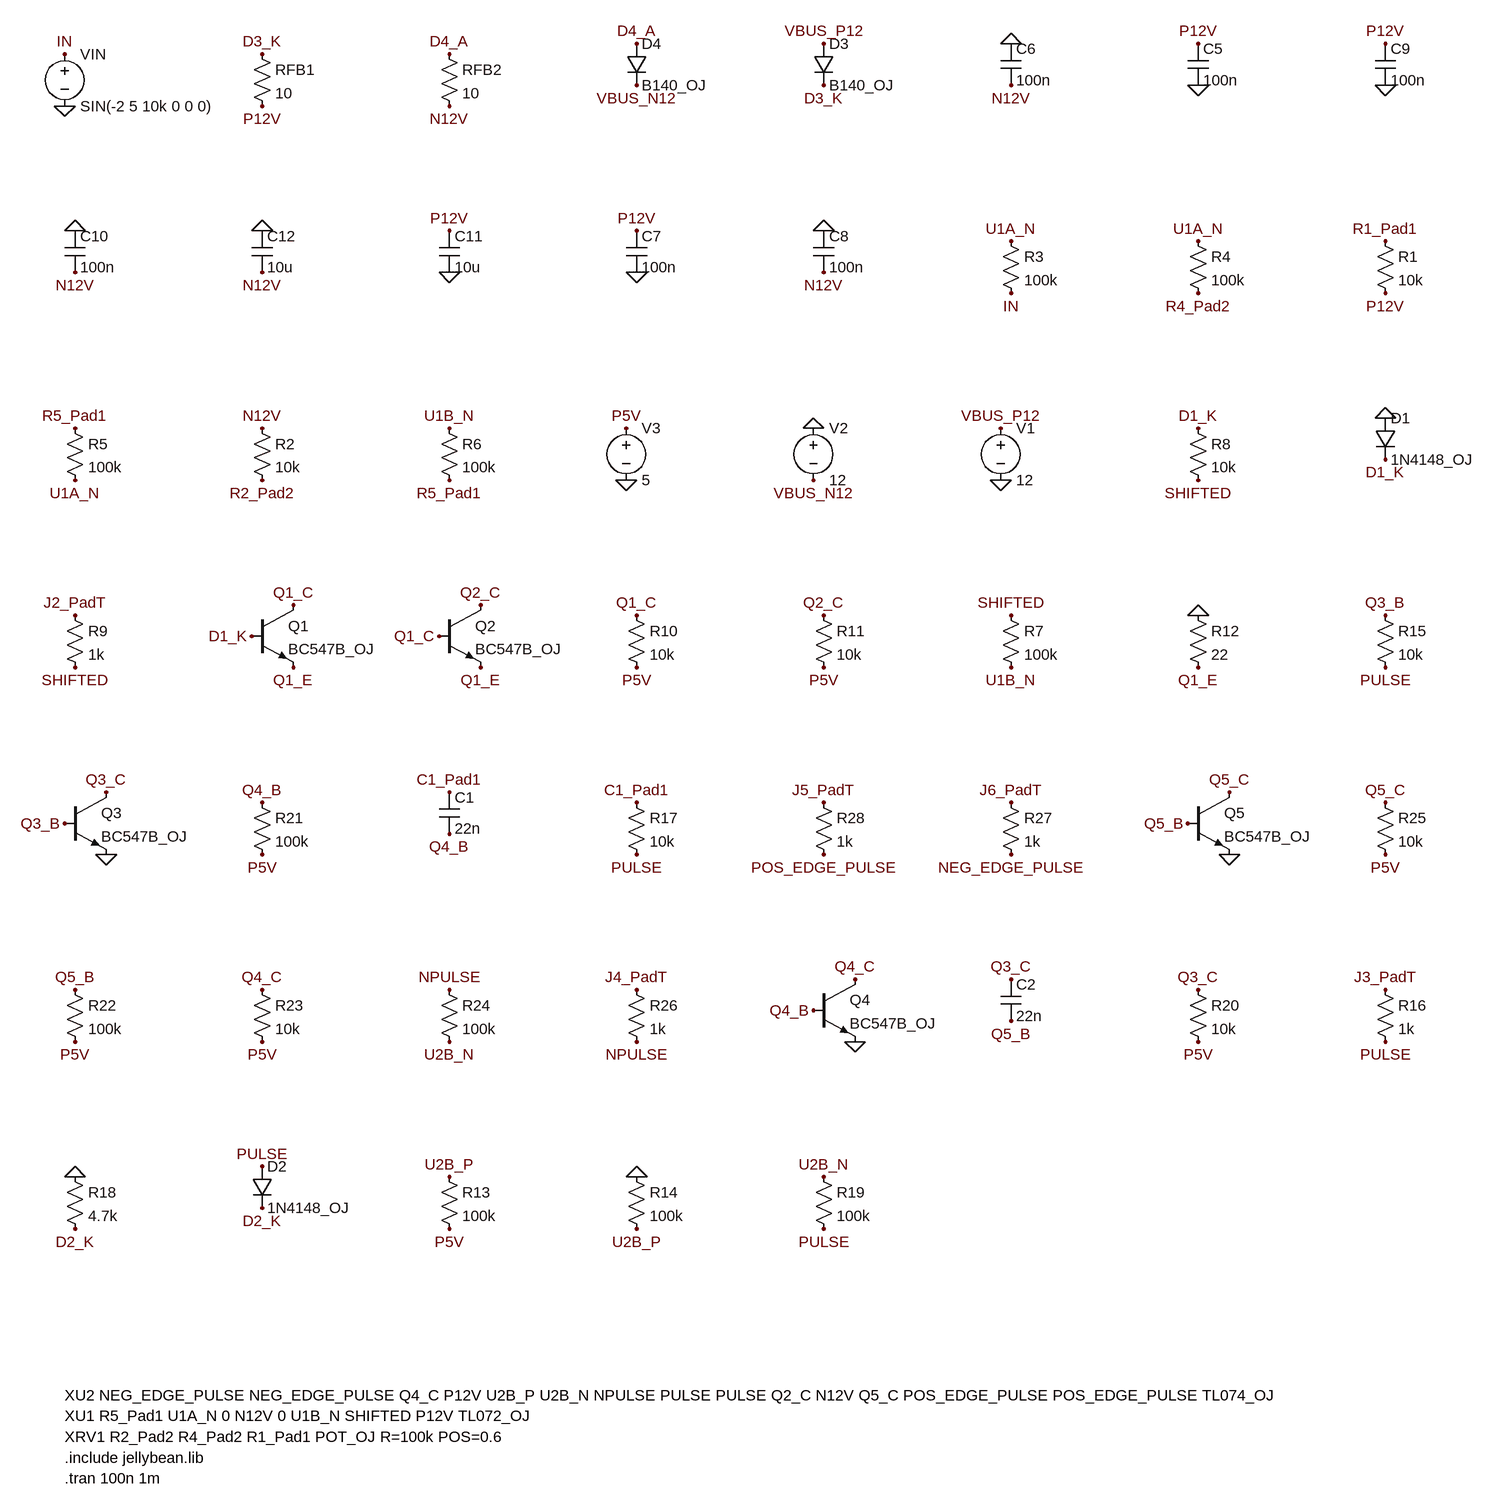
[diagram p0: schematic edges.asc]
edges.asc, the LTspice schematic file:
Version 4.1
SHEET 1 2400 1600
FLAG 0 16 IN
FLAG 0 96 0
FLAG 304 16 D3_K
FLAG 304 96 P12V
FLAG 592 16 D4_A
FLAG 592 96 N12V
FLAG 880 0 D4_A
FLAG 880 64 VBUS_N12
FLAG 1168 0 VBUS_P12
FLAG 1168 64 D3_K
FLAG 1456 0 0
FLAG 1456 64 N12V
FLAG 1744 0 P12V
FLAG 1744 64 0
FLAG 2032 0 P12V
FLAG 2032 64 0
FLAG 16 288 0
FLAG 16 352 N12V
FLAG 304 288 0
FLAG 304 352 N12V
FLAG 592 288 P12V
FLAG 592 352 0
FLAG 880 288 P12V
FLAG 880 352 0
FLAG 1168 288 0
FLAG 1168 352 N12V
FLAG 1456 304 U1A_N
FLAG 1456 384 IN
FLAG 1744 304 U1A_N
FLAG 1744 384 R4_Pad2
FLAG 2032 304 R1_Pad1
FLAG 2032 384 P12V
FLAG 16 592 R5_Pad1
FLAG 16 672 U1A_N
FLAG 304 592 N12V
FLAG 304 672 R2_Pad2
FLAG 592 592 U1B_N
FLAG 592 672 R5_Pad1
FLAG 864 592 P5V
FLAG 864 672 0
FLAG 1152 592 0
FLAG 1152 672 VBUS_N12
FLAG 1440 592 VBUS_P12
FLAG 1440 672 0
FLAG 1744 592 D1_K
FLAG 1744 672 SHIFTED
FLAG 2032 576 0
FLAG 2032 640 D1_K
FLAG 16 880 J2_PadT
FLAG 16 960 SHIFTED
FLAG 352 864 Q1_C
FLAG 288 912 D1_K
FLAG 352 960 Q1_E
FLAG 640 864 Q2_C
FLAG 576 912 Q1_C
FLAG 640 960 Q1_E
FLAG 880 880 Q1_C
FLAG 880 960 P5V
FLAG 1168 880 Q2_C
FLAG 1168 960 P5V
FLAG 1456 880 SHIFTED
FLAG 1456 960 U1B_N
FLAG 1744 880 0
FLAG 1744 960 Q1_E
FLAG 2032 880 Q3_B
FLAG 2032 960 PULSE
FLAG 64 1152 Q3_C
FLAG 0 1200 Q3_B
FLAG 64 1248 0
FLAG 304 1168 Q4_B
FLAG 304 1248 P5V
FLAG 592 1152 C1_Pad1
FLAG 592 1216 Q4_B
FLAG 880 1168 C1_Pad1
FLAG 880 1248 PULSE
FLAG 1168 1168 J5_PadT
FLAG 1168 1248 POS_EDGE_PULSE
FLAG 1456 1168 J6_PadT
FLAG 1456 1248 NEG_EDGE_PULSE
FLAG 1792 1152 Q5_C
FLAG 1728 1200 Q5_B
FLAG 1792 1248 0
FLAG 2032 1168 Q5_C
FLAG 2032 1248 P5V
FLAG 16 1456 Q5_B
FLAG 16 1536 P5V
FLAG 304 1456 Q4_C
FLAG 304 1536 P5V
FLAG 592 1456 NPULSE
FLAG 592 1536 U2B_N
FLAG 880 1456 J4_PadT
FLAG 880 1536 NPULSE
FLAG 1216 1440 Q4_C
FLAG 1152 1488 Q4_B
FLAG 1216 1536 0
FLAG 1456 1440 Q3_C
FLAG 1456 1504 Q5_B
FLAG 1744 1456 Q3_C
FLAG 1744 1536 P5V
FLAG 2032 1456 J3_PadT
FLAG 2032 1536 PULSE
FLAG 16 1744 0
FLAG 16 1824 D2_K
FLAG 304 1728 PULSE
FLAG 304 1792 D2_K
FLAG 592 1744 U2B_P
FLAG 592 1824 P5V
FLAG 880 1744 0
FLAG 880 1824 U2B_P
FLAG 1168 1744 U2B_N
FLAG 1168 1824 PULSE
SYMBOL voltage 0 0 R0
SYMATTR InstName VIN
SYMATTR Value SIN(-2 5 10k 0 0 0)
SYMATTR Value2 AC 1
SYMBOL res 288 0 R0
SYMATTR InstName RFB1
SYMATTR Value 10
SYMBOL res 576 0 R0
SYMATTR InstName RFB2
SYMATTR Value 10
SYMBOL diode 864 0 R0
SYMATTR InstName D4
SYMATTR Value B140_OJ
SYMBOL diode 1152 0 R0
SYMATTR InstName D3
SYMATTR Value B140_OJ
SYMBOL cap 1440 0 R0
SYMATTR InstName C6
SYMATTR Value 100n
SYMBOL cap 1728 0 R0
SYMATTR InstName C5
SYMATTR Value 100n
SYMBOL cap 2016 0 R0
SYMATTR InstName C9
SYMATTR Value 100n
SYMBOL cap 0 288 R0
SYMATTR InstName C10
SYMATTR Value 100n
SYMBOL cap 288 288 R0
SYMATTR InstName C12
SYMATTR Value 10u
SYMBOL cap 576 288 R0
SYMATTR InstName C11
SYMATTR Value 10u
SYMBOL cap 864 288 R0
SYMATTR InstName C7
SYMATTR Value 100n
SYMBOL cap 1152 288 R0
SYMATTR InstName C8
SYMATTR Value 100n
SYMBOL res 1440 288 R0
SYMATTR InstName R3
SYMATTR Value 100k
SYMBOL res 1728 288 R0
SYMATTR InstName R4
SYMATTR Value 100k
SYMBOL res 2016 288 R0
SYMATTR InstName R1
SYMATTR Value 10k
SYMBOL res 0 576 R0
SYMATTR InstName R5
SYMATTR Value 100k
SYMBOL res 288 576 R0
SYMATTR InstName R2
SYMATTR Value 10k
SYMBOL res 576 576 R0
SYMATTR InstName R6
SYMATTR Value 100k
SYMBOL voltage 864 576 R0
SYMATTR InstName V3
SYMATTR Value 5
SYMBOL voltage 1152 576 R0
SYMATTR InstName V2
SYMATTR Value 12
SYMBOL voltage 1440 576 R0
SYMATTR InstName V1
SYMATTR Value 12
SYMBOL res 1728 576 R0
SYMATTR InstName R8
SYMATTR Value 10k
SYMBOL diode 2016 576 R0
SYMATTR InstName D1
SYMATTR Value 1N4148_OJ
SYMBOL res 0 864 R0
SYMATTR InstName R9
SYMATTR Value 1k
SYMBOL npn 288 864 R0
SYMATTR InstName Q1
SYMATTR Value BC547B_OJ
SYMBOL npn 576 864 R0
SYMATTR InstName Q2
SYMATTR Value BC547B_OJ
SYMBOL res 864 864 R0
SYMATTR InstName R10
SYMATTR Value 10k
SYMBOL res 1152 864 R0
SYMATTR InstName R11
SYMATTR Value 10k
SYMBOL res 1440 864 R0
SYMATTR InstName R7
SYMATTR Value 100k
SYMBOL res 1728 864 R0
SYMATTR InstName R12
SYMATTR Value 22
SYMBOL res 2016 864 R0
SYMATTR InstName R15
SYMATTR Value 10k
SYMBOL npn 0 1152 R0
SYMATTR InstName Q3
SYMATTR Value BC547B_OJ
SYMBOL res 288 1152 R0
SYMATTR InstName R21
SYMATTR Value 100k
SYMBOL cap 576 1152 R0
SYMATTR InstName C1
SYMATTR Value 22n
SYMBOL res 864 1152 R0
SYMATTR InstName R17
SYMATTR Value 10k
SYMBOL res 1152 1152 R0
SYMATTR InstName R28
SYMATTR Value 1k
SYMBOL res 1440 1152 R0
SYMATTR InstName R27
SYMATTR Value 1k
SYMBOL npn 1728 1152 R0
SYMATTR InstName Q5
SYMATTR Value BC547B_OJ
SYMBOL res 2016 1152 R0
SYMATTR InstName R25
SYMATTR Value 10k
SYMBOL res 0 1440 R0
SYMATTR InstName R22
SYMATTR Value 100k
SYMBOL res 288 1440 R0
SYMATTR InstName R23
SYMATTR Value 10k
SYMBOL res 576 1440 R0
SYMATTR InstName R24
SYMATTR Value 100k
SYMBOL res 864 1440 R0
SYMATTR InstName R26
SYMATTR Value 1k
SYMBOL npn 1152 1440 R0
SYMATTR InstName Q4
SYMATTR Value BC547B_OJ
SYMBOL cap 1440 1440 R0
SYMATTR InstName C2
SYMATTR Value 22n
SYMBOL res 1728 1440 R0
SYMATTR InstName R20
SYMATTR Value 10k
SYMBOL res 2016 1440 R0
SYMATTR InstName R16
SYMATTR Value 1k
SYMBOL res 0 1728 R0
SYMATTR InstName R18
SYMATTR Value 4.7k
SYMBOL diode 288 1728 R0
SYMATTR InstName D2
SYMATTR Value 1N4148_OJ
SYMBOL res 576 1728 R0
SYMATTR InstName R13
SYMATTR Value 100k
SYMBOL res 864 1728 R0
SYMATTR InstName R14
SYMATTR Value 100k
SYMBOL res 1152 1728 R0
SYMATTR InstName R19
SYMATTR Value 100k
TEXT 0 2080 Left 2 !XU2 NEG_EDGE_PULSE NEG_EDGE_PULSE Q4_C P12V U2B_P U2B_N NPULSE PULSE PULSE Q2_C N12V Q5_C POS_EDGE_PULSE POS_EDGE_PULSE TL074_OJ
TEXT 0 2112 Left 2 !XU1 R5_Pad1 U1A_N 0 N12V 0 U1B_N SHIFTED P12V TL072_OJ
TEXT 0 2144 Left 2 !XRV1 R2_Pad2 R4_Pad2 R1_Pad1 POT_OJ R=100k POS=0.6
TEXT 0 2176 Left 2 !.include jellybean.lib
TEXT 0 2208 Left 2 !.tran 100n 1m

The netlist it stands for:
* edges.asc
VIN IN 0 SIN(-2 5 10k 0 0 0) AC 1
RFB1 D3_K P12V 10
RFB2 D4_A N12V 10
D4 D4_A VBUS_N12 B140_OJ
D3 VBUS_P12 D3_K B140_OJ
C6 0 N12V 100n
C5 P12V 0 100n
C9 P12V 0 100n
C10 0 N12V 100n
C12 0 N12V 10u
C11 P12V 0 10u
C7 P12V 0 100n
C8 0 N12V 100n
R3 U1A_N IN 100k
R4 U1A_N R4_Pad2 100k
R1 R1_Pad1 P12V 10k
R5 R5_Pad1 U1A_N 100k
R2 N12V R2_Pad2 10k
R6 U1B_N R5_Pad1 100k
V3 P5V 0 5
V2 0 VBUS_N12 12
V1 VBUS_P12 0 12
R8 D1_K SHIFTED 10k
D1 0 D1_K 1N4148_OJ
R9 J2_PadT SHIFTED 1k
Q1 Q1_C D1_K Q1_E 0 BC547B_OJ
Q2 Q2_C Q1_C Q1_E 0 BC547B_OJ
R10 Q1_C P5V 10k
R11 Q2_C P5V 10k
R7 SHIFTED U1B_N 100k
R12 0 Q1_E 22
R15 Q3_B PULSE 10k
Q3 Q3_C Q3_B 0 0 BC547B_OJ
R21 Q4_B P5V 100k
C1 C1_Pad1 Q4_B 22n
R17 C1_Pad1 PULSE 10k
R28 J5_PadT POS_EDGE_PULSE 1k
R27 J6_PadT NEG_EDGE_PULSE 1k
Q5 Q5_C Q5_B 0 0 BC547B_OJ
R25 Q5_C P5V 10k
R22 Q5_B P5V 100k
R23 Q4_C P5V 10k
R24 NPULSE U2B_N 100k
R26 J4_PadT NPULSE 1k
Q4 Q4_C Q4_B 0 0 BC547B_OJ
C2 Q3_C Q5_B 22n
R20 Q3_C P5V 10k
R16 J3_PadT PULSE 1k
R18 0 D2_K 4.7k
D2 PULSE D2_K 1N4148_OJ
R13 U2B_P P5V 100k
R14 0 U2B_P 100k
R19 U2B_N PULSE 100k
.model D D
.lib standard.dio
.model NPN NPN
.model PNP PNP
.lib standard.bjt
XU2 NEG_EDGE_PULSE NEG_EDGE_PULSE Q4_C P12V U2B_P U2B_N NPULSE PULSE PULSE Q2_C N12V Q5_C POS_EDGE_PULSE POS_EDGE_PULSE TL074_OJ
XU1 R5_Pad1 U1A_N 0 N12V 0 U1B_N SHIFTED P12V TL072_OJ
XRV1 R2_Pad2 R4_Pad2 R1_Pad1 POT_OJ R=100k POS=0.6
.include jellybean.lib
.tran 100n 1m
.backanno
.end